# Altium schematic sheet Sensors.SchDoc
size 420 x 297 mm; SheetNumber: 5; SheetTotal: 5
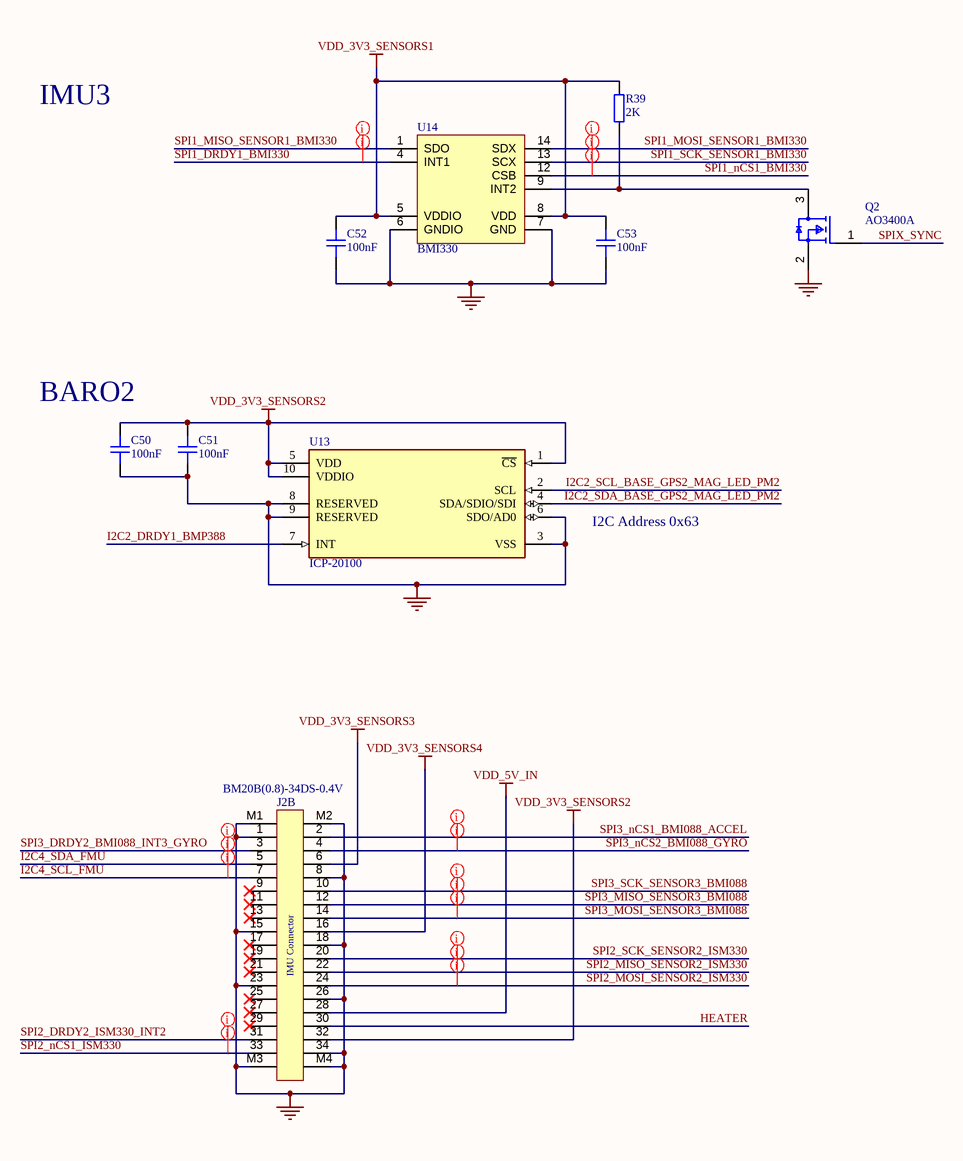
[diagram p0: Sensors.SchDoc]

## Parts
C50  100nF  [CAPC1005X05N]
C51  100nF  [CAPC1005X05N]
C52  100nF  [CAPC1005X05N]
C53  100nF  [CAPC1005X05N]
J2  BM20B(0.8)-34DS-0.4V  [BM20B(0.8)-34DS-0.4V]  (part B of 2)
Q2  AO3400A  [SOT95P280X125-3N]
R39  2K  [RESC1005X04N]
U13  ICP-20100  [BMP390]
U14  BMI330  [ICM-45686]

## Nets
GND: C50.1 C51.1 C52.1 C53.1 J2.1 J2.8 J2.15 J2.18 J2.23 J2.26 J2.34 J2.M1 J2.M2 J2.M3 J2.M4 Q2.2(S) U13.3(VSS) U13.6(SDO/AD0) U13.8(RESERVED) U13.9(RESERVED) U14.6(GNDIO) U14.7(GND)
VDD_3V3_SENSORS1: C52.2 C53.2 R39.2 U14.5(VDDIO) U14.8(VDD)
VDD_3V3_SENSORS2: C50.2 C51.2 J2.32 U13.1(~{CS}) U13.5(VDD) U13.10(VDDIO)
VDD_3V3_SENSORS3: J2.6
VDD_3V3_SENSORS4: J2.16
VDD_5V_IN: J2.28
HEATER: J2.30
I2C2_DRDY1_BMP388: U13.7(INT)
I2C2_SCL_BASE_GPS2_MAG_LED_PM2: U13.2(SCL)
I2C2_SDA_BASE_GPS2_MAG_LED_PM2: U13.4(SDA/SDIO/SDI)
I2C4_SCL_FMU: J2.7
I2C4_SDA_FMU: J2.5
SPI1_DRDY1_BMI330: U14.4(INT1)
SPI1_MISO_SENSOR1_BMI330: U14.1(SDO)
SPI1_MOSI_SENSOR1_BMI330: U14.14(SDX)
SPI1_nCS1_BMI330: U14.12(CSB)
SPI1_SCK_SENSOR1_BMI330: U14.13(SCX)
SPI2_DRDY2_ISM330_INT2: J2.31
SPI2_MISO_SENSOR2_ISM330: J2.22
SPI2_MOSI_SENSOR2_ISM330: J2.24
SPI2_nCS1_ISM330: J2.33
SPI2_SCK_SENSOR2_ISM330: J2.20
SPI3_DRDY2_BMI088_INT3_GYRO: J2.3
SPI3_MISO_SENSOR3_BMI088: J2.12
SPI3_MOSI_SENSOR3_BMI088: J2.14
SPI3_nCS1_BMI088_ACCEL: J2.2
SPI3_nCS2_BMI088_GYRO: J2.4
SPI3_SCK_SENSOR3_BMI088: J2.10
SPIX_SYNC: Q2.1(G)
NetQ2_3: Q2.3(D) R39.1 U14.9(INT2)

Not connected (* = marked no-connect by the designer): J2 9* 11* 13* 17* 19* 21* 25* 27* 29*

## Layout directives
net class SPI1: SPI1_DRDY1_BMI330, SPI1_MISO_SENSOR1_BMI330, SPI1_MOSI_SENSOR1_BMI330, SPI1_nCS1_BMI330, SPI1_SCK_SENSOR1_BMI330
net class SPI3: SPI3_DRDY2_BMI088_INT3_GYRO, SPI3_MISO_SENSOR3_BMI088, SPI3_MOSI_SENSOR3_BMI088, SPI3_nCS1_BMI088_ACCEL, SPI3_nCS2_BMI088_GYRO, SPI3_SCK_SENSOR3_BMI088
net class SPI2: SPI2_DRDY2_ISM330_INT2, SPI2_MISO_SENSOR2_ISM330, SPI2_MOSI_SENSOR2_ISM330, SPI2_nCS1_ISM330, SPI2_SCK_SENSOR2_ISM330
net class I2C4: I2C4_SCL_FMU, I2C4_SDA_FMU

## Notes on the sheet
- IMU3
- (near C50) BARO2
- I2C Address 0x63
- REVISION
- DESCRIPTION
- DATE
- APPROVED
- ENG:
- APPROVALS
- PROJECT
- Xuan Hoa Ward, 72117
- Leman Building
- 20 Truong Dinh
- DSN:
- CHK:
- REFERENCE DOCUMENTS
- PROJECT REVISION:
- TITLE
- DOCUMENT REVISION:
- DESIGN ITEM:
- HCMC, Vietnam
- BOM:
- FAB DWG:
- PCB DWG:
- ASSY DWG:
- FILE NAME
- SIZE
- A3
- DWG NO.
- SHEET
- REV
- OF
- (in symbol IMU PCB connector, part B) IMU Connector

## Library data of the parts
C50-C53 = CAP_0402: Capacitor SMD 0402; Manufacturer: *; Manufacturer Part Number: *; Distributor Link: *; LCSC: *; Rating: *; Dielectric: *
J2 = IMU PCB connector: 34 Position Connector Header, Outer Shroud Contacts Surface Mount Gold
Q2 = 0a9ea7c96deaaede766a5b531c28de0: MOSFET N-CH 30V 5.7A SOT23; Input Capacitance: 630pF; Number of Elements: 1; Rds On Max: 26.5mR; Max Power Dissipation: 1.4W; Gate to Source Voltage (Vgs): 12V; Min Operating Temperature: -55°C; Lead Free: Lead Free; Number of Pins: 3; Drain to Source Voltage (Vdss): 30V; Case/Package: SOT-23; Mount: Surface Mount; Continuous Drain Current (ID): 5.7A; Radiation Hardening: No; Packaging: Tape and Reel; Max Operating Temperature: 150°C; Power Dissipation: 1.4W
R39 = RES_0402: Resistor SMD 0402; Manufacturer: *; Manufacturer Part Number: *; Distributor Link: *; LCSC: *
U13 = 2c5c2094cf923c2d68761797ff94764: ICP-20100 Barometric Pressure and Temperature Sensor IC Digital Output 1.8V/3.3V 10-Pin LGA T/R; NexarPartId: 111934633; Width: 2mm; Min Length: 1.92mm; Max Thickness: 800µm; Max Width: 2.08mm; Min Operating Temperature: -40°C; Max Length: 2.08mm; Min Width: 1.92mm; Min Thickness: 640µm; Length: 2mm
U14 = BMI330: Bosch Sensortec Accelerometer, Gyroscope, Temperature, 3 Axis Sensor I²C, I3C℠, SPI Output